# Altium schematic sheet LED_BUK_2.SchDoc
size A; SheetNumber: 3; SheetTotal: 7
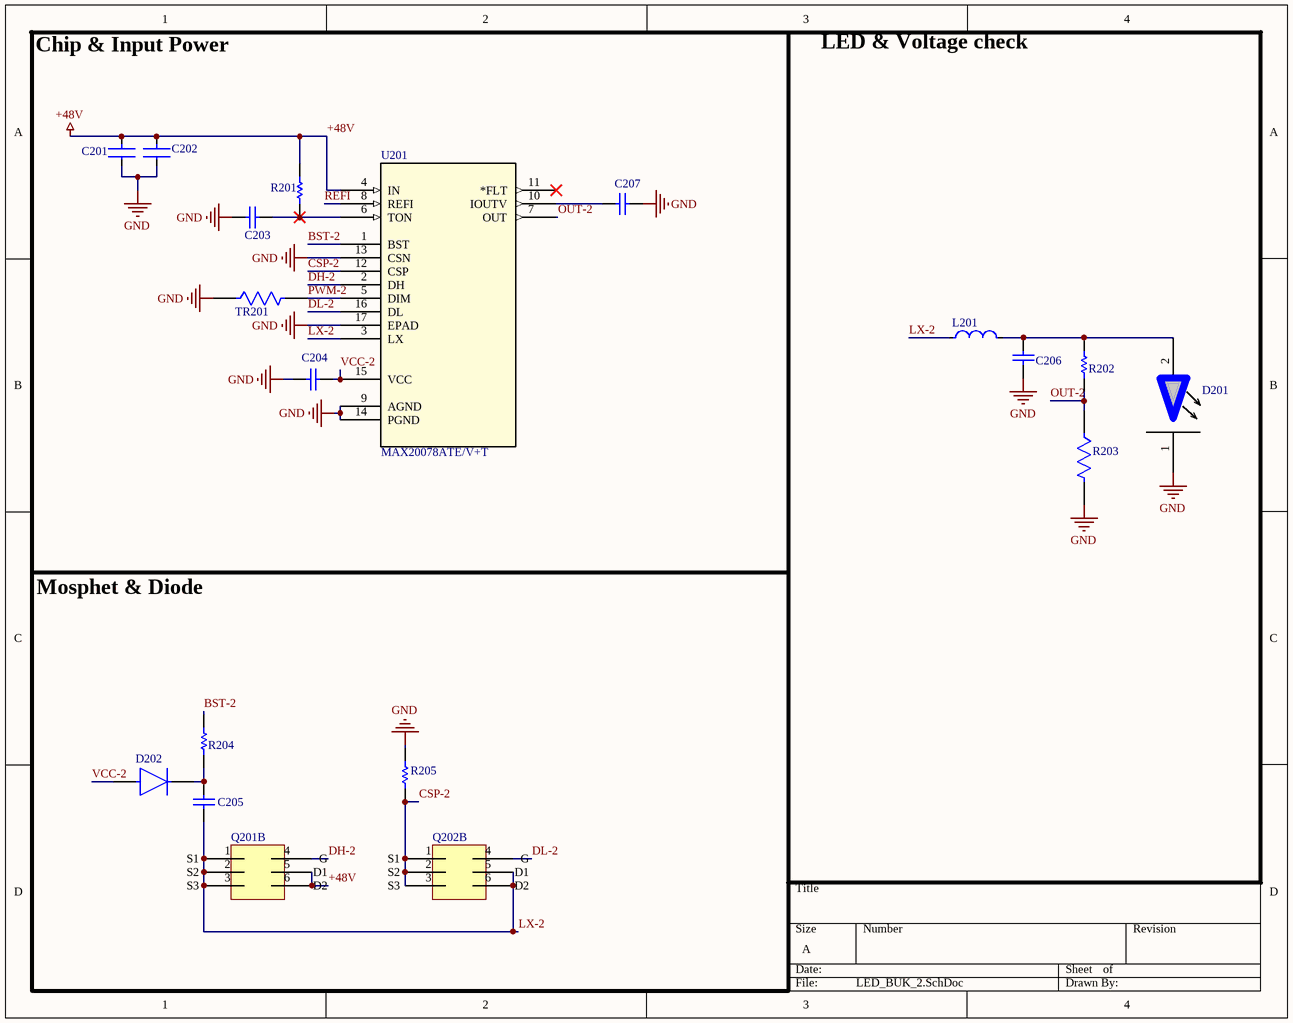
[diagram p0: LED_BUK_2.SchDoc]

## Parts
C201  12101C225KAT2A  [FP-1210-L_3_3_0_4-W_2_5_0-IPC_B]  (value not drawn)
C202  12101C225KAT2A  [FP-1210-L_3_3_0_4-W_2_5_0-IPC_B]  (value not drawn)
C203  GRM1885C1H471JA01D  [C_0603_1608Metric]  (value not drawn)
C204  *AC0805KFX7R7BB225  [C_0805_2012Metric]  (value not drawn)
C205  CL10B224KA8NNNC  [C_0603_1608Metric]  (value not drawn)
C206  CL31B105KCHVPNE  [C_1210_3225Metric]  (value not drawn)
C207  CL31B105KCHVPNE  [C_1210_3225Metric]  (value not drawn)
D201  On back of PCB  [Bridgelux_V22_Custom]  (value not drawn)
D202  B180-13-F  [D_SMA_DO-214AC]  (value not drawn)
L201  YSPI1365-470M  [L_YSPI1365_470M]  (value not drawn)
Q201  custom mosfet  [LFPAK56_SOT669_BUK9Y107]  (value not drawn)  (part B of 2)
Q202  custom mosfet  [LFPAK56_SOT669_BUK9Y107]  (value not drawn)  (part B of 2)
R201  *RC0603FR-0747K5L  [R_0603_1608Metric]  (value not drawn)
R202  RC0603FR-07324KL  [RESC1608X55X25NL10T15]  (value not drawn)
R203  RC0603FR-0724K9L  [FP-RC_L0603-MFG]  (value not drawn)
R204  4R7 1% 0603(1608)  [RESC0603(1608)_M]  (value not drawn)
R205  FRM121WFR100TM  [R_1206_3216Metric]  (value not drawn)
TR201  RC0603FR-0710KL  [FP-RC0603-0_55-IPC_C]  (value not drawn)
U201  MAX20078ATE/V+T  [21-0136V_T1633+4C_MXM]

## Nets
+48V: C201.1 C202.1 Q201.5(D1) Q201.6(D2) R201.1 U201.4(IN)
GND: C201.2 C202.2 C203.1 C204.2 C206.2 C207.2 D201.1 R203.2 R205.1 TR201.1 U201.9(AGND) U201.13(CSN) U201.14(PGND) U201.17(EPAD)
BST-2: R204.2 U201.1(BST)
CSP-2: Q202.1(S1) Q202.2(S2) Q202.3(S3) R205.2 U201.12(CSP)
DH-2: Q201.4(G) U201.2(DH)
DL-2: Q202.4(G) U201.16(DL)
LX-2: C205.2 L201.1 Q201.1(S1) Q201.2(S2) Q201.3(S3) Q202.5(D1) Q202.6(D2) U201.3(LX)
OUT-2: R202.2 R203.1 U201.7(OUT)
PWM-2: TR201.2 U201.5(DIM)
REFI: U201.8(REFI)
VCC-2: C204.1 D202.2(A) U201.15(VCC)
NetC203_2: C203.2 R201.2 U201.6(TON)
NetC205_1: C205.1 D202.1(C) R204.1
NetC206_1: C206.1 D201.2 L201.2 R202.1
NetC207_1: C207.1 U201.10(IOUTV)

Not connected (* = marked no-connect by the designer): U201 11(*FLT)*

## Notes on the sheet
- Chip & Input Power
- LED & Voltage check
- Mosphet & Diode

## Library data of the parts
C201 C202 = CMP-1038-02104-3: General Purpose Ceramic Capacitor, 1210, 2.2uF, 10%, X7R, 15%, 100V; Dissipation Factor: 2.5%; Number of Pins: 2; Lead Free: Lead Free; Voltage Rating: 100V; Min Operating Temperature: -55°C; Height: 2.79mm; Length: 3.2mm; Capacitance: 2.2uF; RoHS Compliant: Yes; Case/Package: 1210; Max Operating Temperature: 125°C; Radiation Hardening: No; Series: -; Case Code (Metric): 3225; Dielectric: X7R; Voltage Rating (DC): 100V; Packaging: Tape and Reel; Width: 2.5mm; Thickness: 0.11inch; Depth: 2.5mm; Contact Plating: Tin; REACH SVHC: No SVHC; Tolerance: 10%; Construction: Flat; Case Code (Imperial): 1210; Mount: Surface Mount; Package Quantity: 1; Termination: SMD/SMT; Voltage: 100V; LCSC Part #: C2168116
C203 = GRM1885C1H471JA01D: 470 pF, 50 V, C0G, 0603; LCSC Part #: C85979; Supplier 1: Avnet; Supplier Part Number 1: GRM1885C1H471JA01D
C204 = AC0805KFX7R7BB225: 2.2 µF, 16 V, X7R, 0805; Supplier 1: Avnet; Supplier Part Number 1: AC0805KFX7R7BB225; LCSC Part #: C20143097
C205 = CL10B224KA8NNNC: 0.22 µF, 25 V, X7R, 0603; Supplier 1: Future Electronics; Supplier Part Number 1: CL10B224KA8NNNC; LCSC Part #: C21120
C206 C207 = CL31B105KCHVPNE: 1 µF, 100 V DC, 1206 (3216 metric); Supplier 1: Mouser; Supplier Part Number 1: 187-CL31B105KCHVPNE; LCSC Part #: C307368
D201 = Bridgelux_V22_Custom
D202 = B180-13-F: Schottky diode, SMA; Supplier 1: Newark; Supplier Part Number 1: B180-13-F; LCSC Part #: C155354
L201 = CompoYSPI1365-470Mnent_1: 47 µH inductor; LCSC Part #: C497913
Q201 Q202 = BUK9Y107-80EX: 80 V N-channel MOSFET; LSCS Part #: C503620; Supplier 1: Arrow Electronics; Supplier Part Number 1: BUK9Y107-80EX
R201 = RC0603FR-0747K5L: 47.5 kΩ; Supplier 1: Newark; Supplier Part Number 1: RC0603FR-0747K5L; LCSC Part #: C137715
R202 = CMP-2000-04009-1: Manufacturer: Yageo; Part Number: RC0603FR-07324KL; LCSC Part #: C273758
R203 = CMP-03412-013083-1: RES SMD 24.9K OHM 1% 1/10W 0603; Manufacturer: Yageo; Approved Alternate Part Number: 541-1.00HHCT-ND; Voltage Rating: 75V; Power Rating: 0.1W; Resistance: 24.9kΩ; Value: 24.9kΩ; Power: 100mW; Temperature Coefficient: 100ppm/°C; Footprint Url: https://www.yageo.com/upload/website/yageo_PYu-R_Mount_10_19050818_343.pdf; Automotive: No; Temperature Range Low: -55°C; Manufacturer Part Number: RC0603FR-0724K9L; Ipc Land Pattern Name: RESC16080X45; Digikey Description: RES SMD 24.9K OHM 1% 1/10W 0603; Voltage: 75V; Composition: Thick Film; Device Class L1: Passive Components; Device Class L2: Resistors; Device Class L3: Chip SMD Resistors; ComponentLink2URL: https://www.yageo.com/upload/media/product/productsearch/datasheet/rchip/PYu-RC_Group_51_RoHS_L_10.pdf; Series: RC_L; Octopart: https://octopart.com/rc0603fr-0724k9l-yageo-1189838; RoHS: TRUE; Category: Res; Height: 0.55mm; Tolerance: 1%; Temperature: -55°C to +155°C; Temperature Range High: +155°C; ComponentLink2Description: Datasheet; Package: RC_L0603; Lead Free: Yes; Mouser Description: Res Thick Film 1.6 x 0.8 mm 24.9K Ohm 1% 0.1W(1/10W) 100ppm/ C Molded SMD Paper T/R; LCSC Part #: C137761
R204 = CMP-1012-00247-1: 4R7 0.1W 1% 0603 (1608 Metric)  SMD; Case-EIA: 0603; Case-Metric: 1608; Value: 4.70 Ohm; Power: 0.1 W; Technology: SMT; Tolerance: 1 %; LCSC Part #: C137705
R205 = FRM121WFR100TM: 0.1 Ω, 1 W, 1206; LCSC Part #: C7467250
TR201 = CMP-2100-03664-2: RES 10K OHM 1% 1/10W 0603; Voltage Rating: 75V; Voltage Rating (DC): 50V; Resistance: 10kR; Power Rating: 100mW; Temperature Coefficient: 100ppm/°C; Depth: 0.8mm; Termination: SMD/SMT; Resistor Type: Thick Film; Series: RC; Construction: Rectangular; Features: Moisture Resistant; Packaging: Tape and Reel; Min Operating Temperature: -55°C; Number of Terminations: 2; Lead Pitch: 0.3mm; RoHS Compliant: Yes; Case/Package: 0603; Resistance Tolerance: 1%; Military Standard: Not; Weight: 7.1E-05oz; Number of Pins: 2; Tolerance: 1%; Length: 1.6mm; Case Code (Imperial): 0603; Lead Free: Lead Free; Width: 0.8mm; Max Power Dissipation: 100mW; Height: 0.45mm; Max Operating Temperature: 155°C; Case Code (Metric): 1608; Size Code: 0603; LCSC Part #: C98220
U201 = MAX20078ATEV+T: Synchronous Buck, High-Brightness LED Controller; Manufacturer_Name: Analog Devices Inc; LSCS Part #: C2679249; Copyright: Copyright (C) 2026 Ultra Librarian. All rights reserved.; Manufacturer_Part_Number: MAX20078ATE/V+T; RefDes: RefDes; Type: Type; Supplier 1: Mouser; Supplier Part Number 1: 700-MAX20078ATE/V+T